# Altium schematic sheet MCU_IO.SchDoc: Skipper MCU IO
size 297 x 210 mm; Author: Jack Herron; SheetNumber: 2; SheetTotal: 11
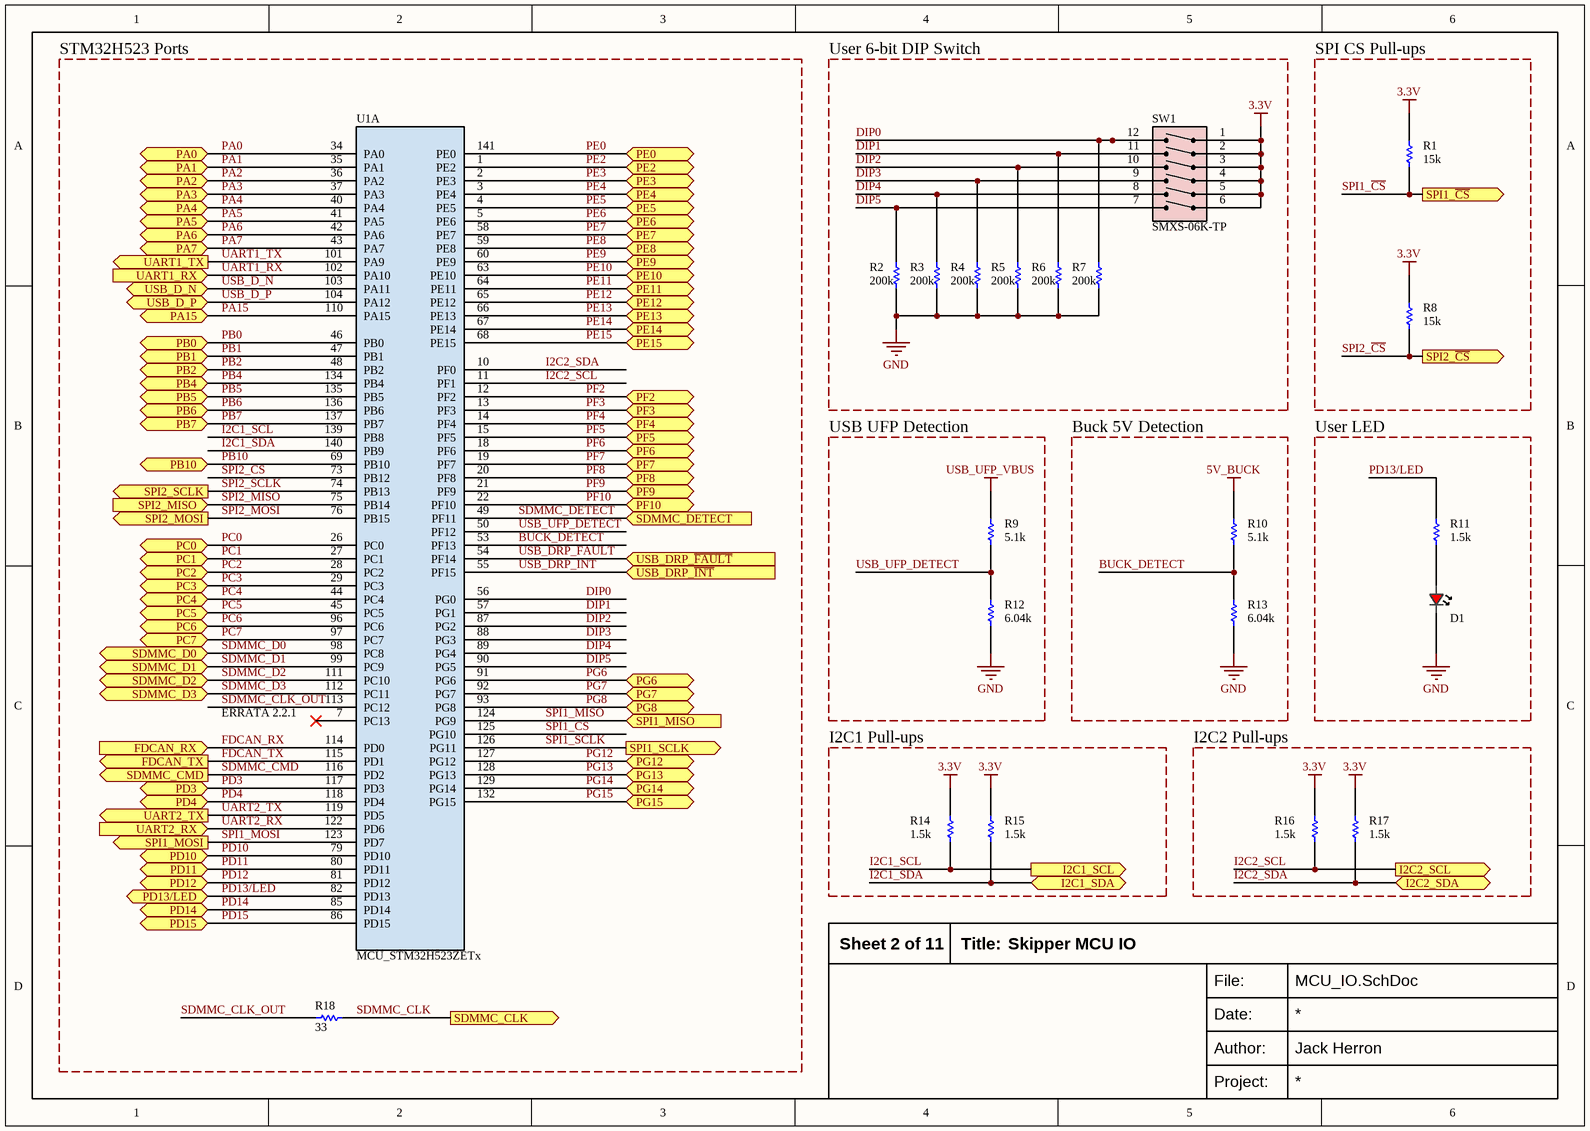
[diagram p0: MCU_IO.SchDoc]

## Parts
D1  KT-0603R  [LED-0603]  (value not drawn)
R1  value 15k  [RESISTOR-0402]  (hidden comment: 0402WGF1502TCE)
R2  value 200k  [RESISTOR-0402]  (hidden comment: 0402WGF2003TCE)
R3  value 200k  [RESISTOR-0402]  (hidden comment: 0402WGF2003TCE)
R4  value 200k  [RESISTOR-0402]  (hidden comment: 0402WGF2003TCE)
R5  value 200k  [RESISTOR-0402]  (hidden comment: 0402WGF2003TCE)
R6  value 200k  [RESISTOR-0402]  (hidden comment: 0402WGF2003TCE)
R7  value 200k  [RESISTOR-0402]  (hidden comment: 0402WGF2003TCE)
R8  value 15k  [RESISTOR-0402]  (hidden comment: 0402WGF1502TCE)
R9  value 5.1k  [RESISTOR-0402]  (hidden comment: 0402WGF5101TCE)
R10  value 5.1k  [RESISTOR-0402]  (hidden comment: 0402WGF5101TCE)
R11  value 1.5k  [RESISTOR-0402]  (hidden comment: 0402WGF1501TCE)
R12  value 6.04k  [RESISTOR-0402]  (hidden comment: RC0402FR-076K04L)
R13  value 6.04k  [RESISTOR-0402]  (hidden comment: RC0402FR-076K04L)
R14  value 1.5k  [RESISTOR-0402]  (hidden comment: 0402WGF1501TCE)
R15  value 1.5k  [RESISTOR-0402]  (hidden comment: 0402WGF1501TCE)
R16  value 1.5k  [RESISTOR-0402]  (hidden comment: 0402WGF1501TCE)
R17  value 1.5k  [RESISTOR-0402]  (hidden comment: 0402WGF1501TCE)
R18  value 33  [RESISTOR-0402]  (hidden comment: 0402WGF330JTCE)
SW1  SMXS-06K-TP  [SWITCH_SMXS-06K-TP]
U1  MCU_STM32H523ZETx  [LQFP-144-22x22]  (part A of 3)

## Blocks framed on the sheet
STM32H523 Ports: R18 U1
User 6-bit DIP Switch: R2-R7 SW1
SPI CS Pull-ups: R1 R8
USB UFP Detection: R9 R12
Buck 5V Detection: R10 R13
User LED: D1 R11
I2C1 Pull-ups: R14 R15
I2C2 Pull-ups: R16 R17

## Ports
FDCAN_RX (in, see Top_Sheet[2C], CAN[2B]), FDCAN_TX (out, see Top_Sheet[2C], CAN[2B]), I2C1_SCL (out, see Top_Sheet[1B], Headers[1D]), I2C1_SDA (bidir, see Top_Sheet[1B], Headers[1D]), I2C2_SCL (out, see Top_Sheet[1B], Headers[3D]), I2C2_SDA (bidir, see Top_Sheet[1B], Headers[3D]), PA0 (bidir, see Top_Sheet[3B]), PA1 (bidir, see Top_Sheet[3B]), PA2 (bidir, see Top_Sheet[2B]), PA3 (bidir, see Top_Sheet[2B]), PA4 (bidir, see Top_Sheet[2B]), PA5 (bidir, see Top_Sheet[6B]), PA6 (bidir, see Top_Sheet[6B]), PA7 (bidir, see Top_Sheet[6B]), PA15 (bidir, see Top_Sheet[4B]), PB0 (bidir, see Top_Sheet[6B]), PB1 (bidir, see Top_Sheet[6B]), PB2 (bidir, see Top_Sheet[3B]), PB4 (bidir, see Top_Sheet[4B]), PB5 (bidir, see Top_Sheet[4B]), PB6 (bidir, see Top_Sheet[4B]), PB7 (bidir, see Top_Sheet[4B]), PB10 (bidir, see Top_Sheet[5B]), PC0 (bidir, see Top_Sheet[6B]), PC1 (bidir, see Top_Sheet[3B]), PC2 (bidir, see Top_Sheet[3B]), PC3 (bidir, see Top_Sheet[3B]), PC4 (bidir, see Top_Sheet[6B]), PC5 (bidir, see Top_Sheet[6B]), PC6 (bidir, see Top_Sheet[4B]), PC7 (bidir, see Top_Sheet[4B]), PD3 (bidir, see Top_Sheet[4B]), PD4 (bidir, see Top_Sheet[4B]), PD10 (bidir, see Top_Sheet[5B]), PD11 (bidir, see Top_Sheet[5B]), PD12 (bidir, see Top_Sheet[5B]), PD13/LED (bidir, see Top_Sheet[5B]), PD14 (bidir, see Top_Sheet[5B]), PD15 (bidir, see Top_Sheet[5B]), PE0 (bidir, see Top_Sheet[3B]), PE2 (bidir, see Top_Sheet[4B]), PE3 (bidir, see Top_Sheet[4B]), PE4 (bidir, see Top_Sheet[4B]), PE5 (bidir, see Top_Sheet[3B]), PE6 (bidir, see Top_Sheet[3B]), PE7 (bidir, see Top_Sheet[5B]), PE8 (bidir, see Top_Sheet[5B]), PE9 (bidir, see Top_Sheet[5B]), PE10 (bidir, see Top_Sheet[5B]), PE11 (bidir, see Top_Sheet[5B]), PE12 (bidir, see Top_Sheet[5B]), PE13 (bidir, see Top_Sheet[5B]), PE14 (bidir, see Top_Sheet[5B]), PE15 (bidir, see Top_Sheet[5B]), PF2 (bidir, see Top_Sheet[3B]), PF3 (bidir, see Top_Sheet[3B]), PF4 (bidir, see Top_Sheet[3B]), PF5 (bidir, see Top_Sheet[3B]), PF6 (bidir, see Top_Sheet[3B]), PF7 (bidir, see Top_Sheet[3B]), PF8 (bidir, see Top_Sheet[3B]), PF9 (bidir, see Top_Sheet[3B]), PF10 (bidir, see Top_Sheet[3B]), PG6 (bidir, see Top_Sheet[5B]), PG7 (bidir, see Top_Sheet[5B]), PG8 (bidir, see Top_Sheet[4B]), PG12 (bidir, see Top_Sheet[4B]), PG13 (bidir, see Top_Sheet[4B]), PG14 (bidir, see Top_Sheet[4B]), PG15 (bidir, see Top_Sheet[4B]), SDMMC_CLK (out, see Top_Sheet[2C], SDMMC[2C]), SDMMC_CMD (out, see Top_Sheet[2C], SDMMC[2C]), SDMMC_D0 (bidir, see Top_Sheet[2C], SDMMC[2B]), SDMMC_D1 (bidir, see Top_Sheet[2C], SDMMC[2B]), SDMMC_D2 (bidir, see Top_Sheet[2C], SDMMC[2C]), SDMMC_D3 (bidir, see Top_Sheet[2C], SDMMC[2C]), SDMMC_DETECT (in, see Top_Sheet[2C], SDMMC[2C]), SPI1_MISO (in, see Top_Sheet[2B], Headers[1D]), SPI1_MOSI (out, see Top_Sheet[2B], Headers[1D]), SPI1_SCLK (out, see Top_Sheet[2B], Headers[1C]), SPI1_~{CS} (out, see Top_Sheet[2B], Headers[1C]), SPI2_MISO (in, see Top_Sheet[2B], Headers[3D]), SPI2_MOSI (out, see Top_Sheet[2B], Headers[3D]), SPI2_SCLK (out, see Top_Sheet[2B], Headers[3C]), SPI2_~{CS} (out, see Top_Sheet[2B], Headers[3C]), UART1_RX (in, see Top_Sheet[2B], Headers[1D]), UART1_TX (out, see Top_Sheet[2B], Headers[1D]), UART2_RX (in, see Top_Sheet[2B], Headers[3D]), UART2_TX (out, see Top_Sheet[2B], Headers[3D]), USB_D_N (bidir, see Top_Sheet[1C]), USB_D_P (bidir, see Top_Sheet[1C]), USB_DRP_~{FAULT} (in, see Top_Sheet[2C]), USB_DRP_~{INT} (in, see Top_Sheet[1C])

## Nets
3.3V: R1.2 R8.2 R14.2 R15.2 R16.2 R17.2 SW1.1 SW1.2 SW1.3 SW1.4 SW1.5 SW1.6
5V_BUCK: R10.2
GND: D1.K R2.1 R3.1 R4.1 R5.1 R6.1 R7.1 R12.1 R13.1
USB_UFP_VBUS: R9.2
BUCK_DETECT: R10.1 R13.2 U1.53(PF13)
DIP0: R7.2 SW1.12 U1.56(PG0)
DIP1: R6.2 SW1.11 U1.57(PG1)
DIP2: R5.2 SW1.10 U1.87(PG2)
DIP3: R4.2 SW1.9 U1.88(PG3)
DIP4: R3.2 SW1.8 U1.89(PG4)
DIP5: R2.2 SW1.7 U1.90(PG5)
FDCAN_RX: U1.114(PD0) ; port FDCAN_RX
FDCAN_TX: U1.115(PD1) ; port FDCAN_TX
I2C1_SCL: R14.1 U1.139(PB8) ; port I2C1_SCL
I2C1_SDA: R15.1 U1.140(PB9) ; port I2C1_SDA
I2C2_SCL: R16.1 U1.11(PF1) ; port I2C2_SCL
I2C2_SDA: R17.1 U1.10(PF0) ; port I2C2_SDA
PA0: U1.34(PA0) ; port PA0
PA1: U1.35(PA1) ; port PA1
PA2: U1.36(PA2) ; port PA2
PA3: U1.37(PA3) ; port PA3
PA4: U1.40(PA4) ; port PA4
PA5: U1.41(PA5) ; port PA5
PA6: U1.42(PA6) ; port PA6
PA7: U1.43(PA7) ; port PA7
PA15: U1.110(PA15) ; port PA15
PB0: U1.46(PB0) ; port PB0
PB1: U1.47(PB1) ; port PB1
PB2: U1.48(PB2) ; port PB2
PB4: U1.134(PB4) ; port PB4
PB5: U1.135(PB5) ; port PB5
PB6: U1.136(PB6) ; port PB6
PB7: U1.137(PB7) ; port PB7
PB10: U1.69(PB10) ; port PB10
PC0: U1.26(PC0) ; port PC0
PC1: U1.27(PC1) ; port PC1
PC2: U1.28(PC2) ; port PC2
PC3: U1.29(PC3) ; port PC3
PC4: U1.44(PC4) ; port PC4
PC5: U1.45(PC5) ; port PC5
PC6: U1.96(PC6) ; port PC6
PC7: U1.97(PC7) ; port PC7
PD3: U1.117(PD3) ; port PD3
PD4: U1.118(PD4) ; port PD4
PD10: U1.79(PD10) ; port PD10
PD11: U1.80(PD11) ; port PD11
PD12: U1.81(PD12) ; port PD12
PD13/LED: R11.2 U1.82(PD13) ; port PD13/LED
PD14: U1.85(PD14) ; port PD14
PD15: U1.86(PD15) ; port PD15
PE0: U1.141(PE0) ; port PE0
PE2: U1.1(PE2) ; port PE2
PE3: U1.2(PE3) ; port PE3
PE4: U1.3(PE4) ; port PE4
PE5: U1.4(PE5) ; port PE5
PE6: U1.5(PE6) ; port PE6
PE7: U1.58(PE7) ; port PE7
PE8: U1.59(PE8) ; port PE8
PE9: U1.60(PE9) ; port PE9
PE10: U1.63(PE10) ; port PE10
PE11: U1.64(PE11) ; port PE11
PE12: U1.65(PE12) ; port PE12
PE13: U1.66(PE13) ; port PE13
PE14: U1.67(PE14) ; port PE14
PE15: U1.68(PE15) ; port PE15
PF2: U1.12(PF2) ; port PF2
PF3: U1.13(PF3) ; port PF3
PF4: U1.14(PF4) ; port PF4
PF5: U1.15(PF5) ; port PF5
PF6: U1.18(PF6) ; port PF6
PF7: U1.19(PF7) ; port PF7
PF8: U1.20(PF8) ; port PF8
PF9: U1.21(PF9) ; port PF9
PF10: U1.22(PF10) ; port PF10
PG6: U1.91(PG6) ; port PG6
PG7: U1.92(PG7) ; port PG7
PG8: U1.93(PG8) ; port PG8
PG12: U1.127(PG12) ; port PG12
PG13: U1.128(PG13) ; port PG13
PG14: U1.129(PG14) ; port PG14
PG15: U1.132(PG15) ; port PG15
SDMMC_CLK: R18.1 ; port SDMMC_CLK
SDMMC_CLK_OUT: R18.2 U1.113(PC12)
SDMMC_CMD: U1.116(PD2) ; port SDMMC_CMD
SDMMC_D0: U1.98(PC8) ; port SDMMC_D0
SDMMC_D1: U1.99(PC9) ; port SDMMC_D1
SDMMC_D2: U1.111(PC10) ; port SDMMC_D2
SDMMC_D3: U1.112(PC11) ; port SDMMC_D3
SDMMC_DETECT: U1.49(PF11) ; port SDMMC_DETECT
SPI1_~{CS}: R1.1 U1.125(PG10) ; port SPI1_~{CS}
SPI1_MISO: U1.124(PG9) ; port SPI1_MISO
SPI1_MOSI: U1.123(PD7) ; port SPI1_MOSI
SPI1_SCLK: U1.126(PG11) ; port SPI1_SCLK
SPI2_~{CS}: R8.1 U1.73(PB12) ; port SPI2_~{CS}
SPI2_MISO: U1.75(PB14) ; port SPI2_MISO
SPI2_MOSI: U1.76(PB15) ; port SPI2_MOSI
SPI2_SCLK: U1.74(PB13) ; port SPI2_SCLK
UART1_RX: U1.102(PA10) ; port UART1_RX
UART1_TX: U1.101(PA9) ; port UART1_TX
UART2_RX: U1.122(PD6) ; port UART2_RX
UART2_TX: U1.119(PD5) ; port UART2_TX
USB_D_N: U1.103(PA11) ; port USB_D_N
USB_D_P: U1.104(PA12) ; port USB_D_P
USB_DRP_~{FAULT}: U1.54(PF14) ; port USB_DRP_~{FAULT}
USB_DRP_~{INT}: U1.55(PF15) ; port USB_DRP_~{INT}
USB_UFP_DETECT: R9.1 R12.2 U1.50(PF12)
NetD1_A: D1.A R11.1

Not connected (* = marked no-connect by the designer): U1 7(PC13)*

## Notes on the sheet
- ERRATA 2.2.1
- Title:
- File:
- Date:
- Project:
- Author:

## Library data of the parts
D1 = LED_KT-0603R: LED - Red - 0603; Manufacturer 1: Hubei KENTO Elec; Manufacturer Part Number 1: KT-0603R; Supplier 1: LCSC; Supplier Part Number 1: C2286
R1 R8 = RESISTOR_0402WGF1502TCE: Resistor - 15k - 0402; Manufacturer 1: UNI-ROYAL; Voltage: 50V; Wattage: 62.5mW; Manufacturer Part Number 1: 0402WGF1502TCE; Supplier 1: LCSC; Supplier Part Number 1: C25756
R2-R7 = RESISTOR_0402WGF2003TCE: Resistor - 200k - 0402; Manufacturer 1: UNI-ROYAL; Wattage: 62.5mW; Voltage: 50V; Manufacturer Part Number 1: 0402WGF2003TCE; Supplier 1: LCSC; Supplier Part Number 1: C25764
R9 R10 = RESISTOR_0402WGF5101TCE: Resistor - 5.1k - 0402; Manufacturer 1: UNI-ROYAL; Voltage: 50V; Wattage: 62.5mW; Manufacturer Part Number 1: 0402WGF5101TCE; Supplier 1: LCSC; Supplier Part Number 1: C25905
R11 R14-R17 = RESISTOR_0402WGF1501TCE: Resistor - 1.5k - 0402; Manufacturer 1: UNI-ROYAL; Voltage: 50V; Wattage: 62.5mW; Manufacturer Part Number 1: 0402WGF1501TCE; Supplier 1: LCSC; Supplier Part Number 1: C25867
R12 R13 = RESISTOR_RC0402FR-076K04L: Resistor - 6.04k - 0402; Manufacturer 1: Yageo; Voltage: 50V; Wattage: 62.5mW; Manufacturer Part Number 1: RC0402FR-076K04L; Supplier 1: LCSC; Supplier Part Number 1: C97819
R18 = RESISTOR_0402WGF330JTCE: Resistor - 33 -0402; Manufacturer 1: UNI-ROYAL(Uniroyal Elec); Voltage: 50V; Wattage: 62.5mW; Manufacturer Part Number 1: 0402WGF330JTCE; Supplier 1: LCSC; Supplier Part Number 1: C25105
SW1 = SWITCH_SMXS-06K-TP: 6 bit DIP switch; Manufacturer 1: SM Switch; Manufacturer Part Number 1: SMXS-06K-TP; Supplier 1: LCSC; Supplier Part Number 1: C5439765
U1 = MCU_STM32H523ZETx: Arm Cortex-M33 MCU - 512KB Flash - 272KB SRAM - 250 MHz - LQFP144; Manufacturer 1: ST; Manufacturer Part Number 1: STM32H523ZET6; Supplier 1: Mouser; Supplier Part Number 1: 511-STM32H523ZET6